# Altium schematic sheet DIB_connect.SchDoc
size A4; SheetNumber: 2; SheetTotal: 2
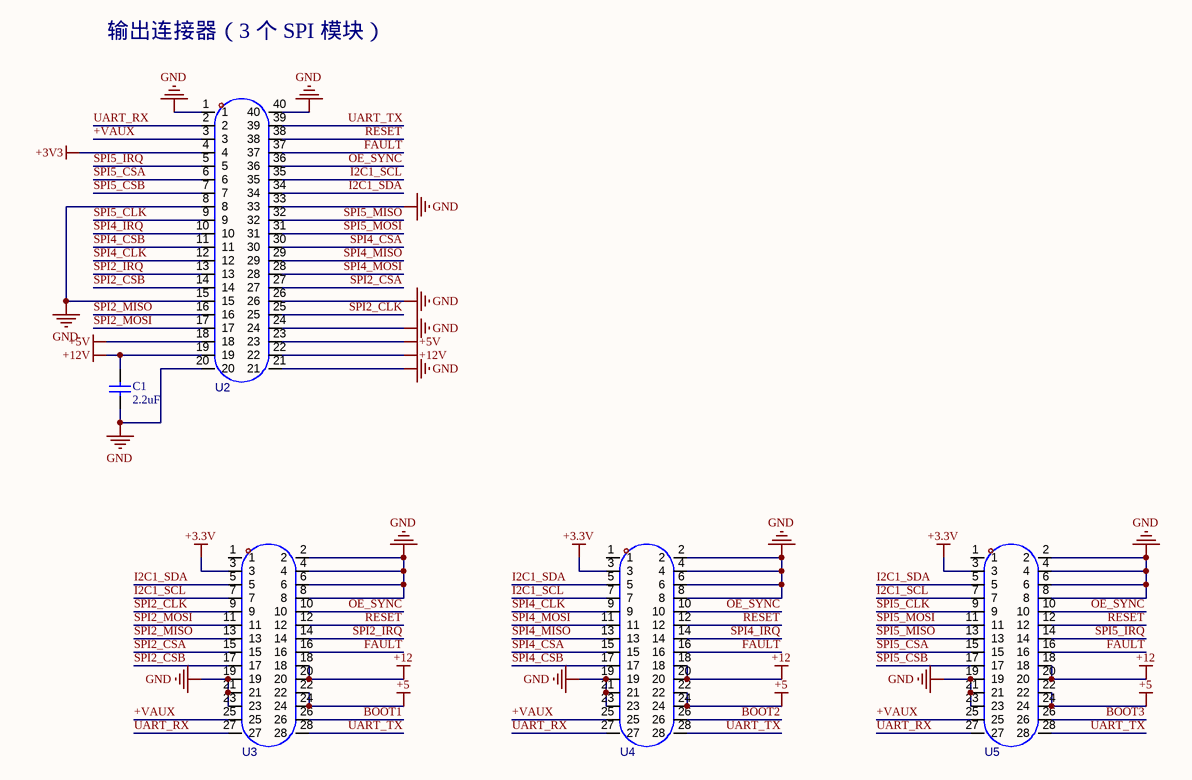
[diagram p0: DIB_connect.SchDoc]

## Parts
C1  2.2uF  [C0603]
U2  ds1024-2x20r2  [HDR-TH_40P-P2.54-H-F-R2-C20-S2.54-W8.5]  (value not drawn)
U3  hc-pm254-8.5h-2x14pz  [HDR-TH_28P-P2.54-V-F-R2-C14-S2.54]  (value not drawn)
U4  hc-pm254-8.5h-2x14pz  [HDR-TH_28P-P2.54-V-F-R2-C14-S2.54]  (value not drawn)
U5  hc-pm254-8.5h-2x14pz  [HDR-TH_28P-P2.54-V-F-R2-C14-S2.54]  (value not drawn)

## Nets
+3.3V: U3.3 U4.3 U5.3
+3V3: U2.4
+5: U3.22 U3.24 U4.22 U4.24 U5.22 U5.24
+5V: U2.18 U2.23
+12: U3.18 U3.20 U4.18 U4.20 U5.18 U5.20
+12V: C1.2 U2.19 U2.22
GND: C1.1 U2.1 U2.8 U2.15 U2.20 U2.21 U2.24 U2.26 U2.33 U2.40 U3.2 U3.4 U3.6 U3.8 U3.19 U3.21 U3.23 U4.2 U4.4 U4.6 U4.8 U4.19 U4.21 U4.23 U5.2 U5.4 U5.6 U5.8 U5.19 U5.21 U5.23
+VAUX: U2.3 U3.25 U4.25 U5.25
BOOT1: U3.26
BOOT2: U4.26
BOOT3: U5.26
FAULT: U2.37 U3.16 U4.16 U5.16
I2C1_SCL: U2.35 U3.7 U4.7 U5.7
I2C1_SDA: U2.34 U3.5 U4.5 U5.5
OE_SYNC: U2.36 U3.10 U4.10 U5.10
RESET: U2.38 U3.12 U4.12 U5.12
SPI2_CLK: U2.25 U3.9
SPI2_CSA: U2.27 U3.15
SPI2_CSB: U2.14 U3.17
SPI2_IRQ: U2.13 U3.14
SPI2_MISO: U2.16 U3.13
SPI2_MOSI: U2.17 U3.11
SPI4_CLK: U2.12 U4.9
SPI4_CSA: U2.30 U4.15
SPI4_CSB: U2.11 U4.17
SPI4_IRQ: U2.10 U4.14
SPI4_MISO: U2.29 U4.13
SPI4_MOSI: U2.28 U4.11
SPI5_CLK: U2.9 U5.9
SPI5_CSA: U2.6 U5.15
SPI5_CSB: U2.7 U5.17
SPI5_IRQ: U2.5 U5.14
SPI5_MISO: U2.32 U5.13
SPI5_MOSI: U2.31 U5.11
UART_RX: U2.2 U3.27 U4.27 U5.27
UART_TX: U2.39 U3.28 U4.28 U5.28

Not connected (* = marked no-connect by the designer): U3 1; U4 1; U5 1

## Notes on the sheet
- 输出连接器（3 个 SPI 模块）

## Library data of the parts
C1 = C0603: Capacitor; Value: 104; Published: 8-Jun-2000; LatestRevisionDate: 17-Jul-2002; LatestRevisionNote: Re-released for DXP Platform.; Publisher: Altium Limited
U2 = ds1024-2x20r2: 插孔结构:2x20P;间距:2.54mm;行距:2.54mm;圆孔/方孔:方孔;安装方式:弯插;排数:双排;总孔位数:40P;额定电流:3A;额定电压:250V;插孔方向:侧面;塑高:2.5mm;触头镀层:金镍;工作温度:-40℃~+105℃;; Manufacturer: CONNFLY; AddInBom: yes; ModelId: a9ccadb72efd4c37a205c7e50d3d2ca6; ModelTransform: 2023.618,499.999,0,180,0,0,0,192.917,-125.984; Holes Structure: 2x20P; Pitch: 2.54mm; Circular Hole / Square Hole: 方孔; Number of Positions: 40P; Current Rating: 3A; Voltage Rating (Max): 250V; Holes Direction: 侧面; Symbol: DS1024-2X20R2; LCSC Part Name: 黑色 2x20P 间距:2.54mm 弯插; SupplierPart: C7509545; ManufacturerPart: DS1024-2x20R2; Supplier Footprint: 弯插,P=2.54mm; JLCPCB Part Class: Extended Part; Datasheet: https://item.szlcsc.com/datasheet/DS1024-2x20R2/8601981.html; Supplier: LCSC; ConvertToPcb: yes; FootprintName: HDR-TH_40P-P2.54-H-F-R2-C20-S2.54-W8.5; ModelName: HDR-TH_40P-P2.54-H-F-R2-C20-S2.54-W8.5; Row Spacing: 2.54mm; Mounting Type: 弯插; Number of Rows: 双排; Insulation Height: 2.5mm; Contact Plating: 金镍; Operating Temperature: -40℃~+105℃
U3-U5 = hc-pm254-8.5h-2x14pz: 插孔结构:2x14P;间距:2.54mm;行距:2.54mm;圆孔/方孔:方孔;安装方式:直插;排数:双排;总孔位数:28P;额定电流:3A;额定电压:-;插孔方向:顶部;塑高:8.5mm;触头材质:黄铜;触头镀层:金;工作温度:-40℃~+105℃;; Manufacturer: HC(虹成电子); AddInBom: yes; ModelId: 7a003188d48b46d1b4dfaea3b006a9b7; ModelName: HDR-TH_28P-P2.54-F-LI-2X14P; ModelTransform: 1419.682,196.85,0,0,0,0,0,0,-118.11; Holes Structure: 2x14P; Pitch: 2.54mm; Circular Hole / Square Hole: 方孔; Number of Positions: 28P; Current Rating: 3A; Holes Direction: 顶部; PIN Length: 3mm; Symbol: HC-PM254-8.5H-2X14PZ; LCSC Part Name: 间距2.54mm 2x14Pin 直插 PC3.0 H8.5; SupplierPart: C22373919; ManufacturerPart: HC-PM254-8.5H-2x14PZ; Supplier Footprint: 插件,P=2.54mm; JLCPCB Part Class: Extended Part; Datasheet: https://item.szlcsc.com/datasheet/HC-PM254-8.5H-2x14PZ/23870255.html; Supplier: LCSC; ConvertToPcb: yes; FootprintName: HDR-TH_28P-P2.54-V-F-R2-C14-S2.54; Row Spacing: 2.54mm; Mounting Type: 直插; Number of Rows: 双排; Voltage Rating (Max): -; Insulation Height: 8.5mm; Contact Material: 黄铜; Contact Plating: 金; Operating Temperature: -40℃~+105℃; Supplementary Features: -